# EasyEDA Pro project htx-studio-project_kpilekig-42ad306f.epro, schematic Adapter
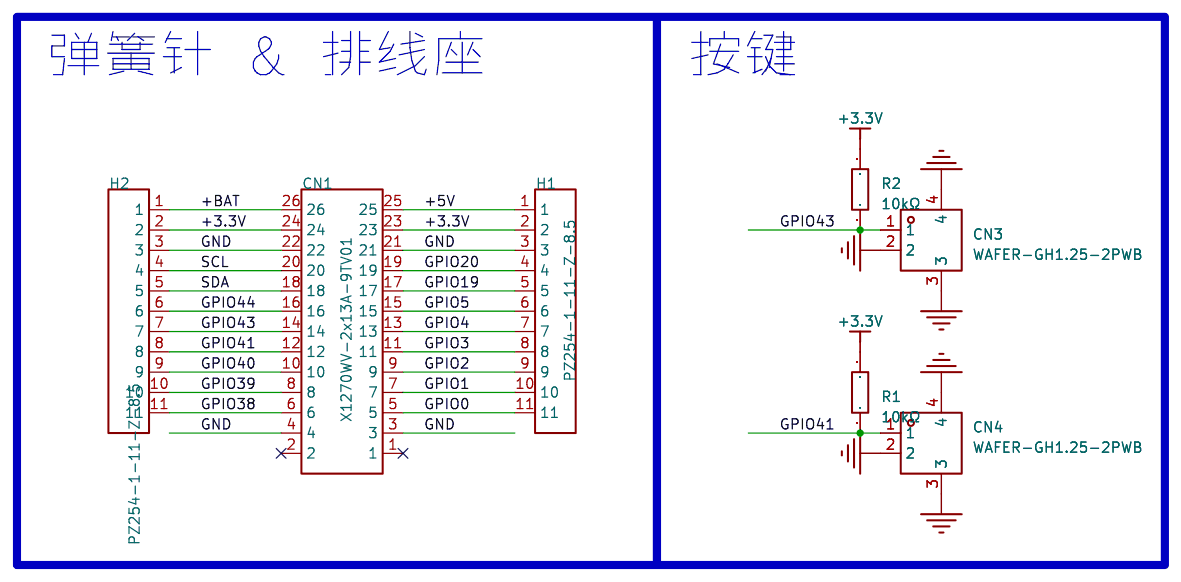
[diagram p1: schematic sheet]

## Parts
CN1  X1270WV-2x13A-9TV01  [IDC-TH_X1270WV-2X13A-6TV01]
CN3  WAFER-GH1.25-2PWB  [CONN-TH_2P-P1.25_XUNPU_WAFER-GH1.25-2PWB]
CN4  WAFER-GH1.25-2PWB  [CONN-TH_2P-P1.25_XUNPU_WAFER-GH1.25-2PWB]
H1  PZ254-1-11-Z-8.5  [HDR-TH_11P-P2.54-V-M]
H2  PZ254-1-11-Z-8.5  [HDR-TH_11P-P2.54-V-M]
R1  10kΩ  [R0402]
R2  10kΩ  [R0402]

## Library data of the parts
CN1 = X1270WV-2x13A-9TV01: 连接器类型:-;间距:-;额定电流:-;额定电压:-;安装方式:-;行距:-;排数:-;每排PIN数:-;触头材质:-;触头镀层:-;工作温度:-;; Supplier Part: C2962229; Manufacturer: XKB Connection(中国星坤); Supplier Footprint: 插件,P=1.27mm; JLCPCB Part Class: 扩展库; Datasheet: https://item.szlcsc.com/datasheet/X1270WV-2x13A-9TV01/3351705.html; Supplier: LCSC
CN3 CN4 = WAFER-GH1.25-2PWB: 插针结构:1x2P;间距:1.25mm;安装方式:卧贴;参考系列:GH;总PIN数:2P;排数:1;每排PIN数:2;额定电流:1A;工作温度范围:-25℃~+85℃;; LCSC Part Name: 1x2P 间距:1.25mm 卧贴 系列:GH; Supplier Part: C3029377; Manufacturer: XUNPU(讯普); Supplier Footprint: SMD,P=1.25mm,卧贴; JLCPCB Part Class: 扩展库; Datasheet: https://atta.szlcsc.com/upload/public/pdf/source/20220527/CB8773BFB0913C3B8ABD62CB38BA101A.pdf; Supplier: LCSC; Pins Structure: 1x2P; Pitch: 1.25mm; Mounting Style: 卧贴; Reference Series: GH; Number of Pins: 2P; Number of Rows: 1; Number of PINs Per Row: 2; Current Rating (Max): 1A; Operating Temperature Range: -25℃~+85℃
H1 H2 = PZ254-1-11-Z-8.5: 插针结构:1x11P;间距:2.54mm;行距:-;圆针/方针:方针;安装方式:直插;排数:单排;总PIN位数:11P;额定电流:3A;额定电压:-;配合针长度:6mm;塑高:2.5mm;端接针长度:3mm;触头材质:黄铜;工作温度:-40℃~+105℃;颜色:黑色;; LCSC Part Name: 1x11P 间距:2.54mm 方针 直插; Supplier Part: C2894934; Manufacturer: HCTL(华灿天禄); Supplier Footprint: 插件,P=2.54mm; JLCPCB Part Class: 扩展库; Datasheet: https://atta.szlcsc.com/upload/public/pdf/source/20240305/0F0A2A5C422E5D195558C9C26715A031.pdf; Supplier: LCSC; Pin Structure: 1x11P; Pitch: 2.54mm; Circluar Pins/Square Pins: 方针; Mounting Type: 直插; Number of Rows: 单排; Number of Pins: 11P; Current Rating: 3A; Length of Mating Pin: 6mm; Insulation Height: 2.5mm; Length of End Connection Pin: 3mm; Contact Material: 黄铜; Operating Temperature: -40℃~+105℃; Color: 黑色
R1 R2 = 0402WGF1002TCE: 电阻类型:厚膜电阻;阻值:10kΩ;精度:±1%;功率:62.5mW;最大工作电压:50V;温度系数:±100ppm/℃;; LCSC Part Name: 10kΩ ±1% 62.5mW 厚膜电阻; Supplier Part: C25744; Manufacturer: UNI-ROYAL(厚声); Supplier Footprint: 0402; JLCPCB Part Class: 基础库; Datasheet: https://atta.szlcsc.com/upload/public/pdf/source/20200306/C422600_1E6D84923E4A46A82E41ADD87F860B5C.pdf; Supplier: LCSC; Type: 厚膜电阻; Tolerance: ±1%; Power(Watts): 62.5mW; Overload Voltage (Max): 50V; Temperature Coefficient: ±100ppm/℃; Operating Temperature Range: -55℃~+155℃

## Nets
+3.3V: CN1.23 CN1.24 H1.2 H2.2 R1.2 R2.2
+5V: CN1.25 H1.1
GND: CN1.3 CN1.4 CN1.21 CN1.22 CN3.2 CN3.3 CN3.4 CN4.2 CN4.3 CN4.4 H1.3 H2.3
+BAT: CN1.26 H2.1
GPIO0: CN1.5 H1.11
GPIO1: CN1.7 H1.10
GPIO2: CN1.9 H1.9
GPIO3: CN1.11 H1.8
GPIO4: CN1.13 H1.7
GPIO5: CN1.15 H1.6
GPIO19: CN1.17 H1.5
GPIO20: CN1.19 H1.4
GPIO38: CN1.6 H2.11
GPIO39: CN1.8 H2.10
GPIO40: CN1.10 H2.9
GPIO41: CN1.12 CN4.1 H2.8 R1.1
GPIO43: CN1.14 CN3.1 H2.7 R2.1
GPIO44: CN1.16 H2.6
SCL: CN1.20 H2.4
SDA: CN1.18 H2.5

Not connected (* = marked no-connect by the designer): CN1 1* 2*

## Notes on the sheet
- 弹簧针 & 排线座
- 按键
